# EasyEDA Pro project climbsnail-spotwelder-45c7d2f7.epro, board 大号控制板测试（可打板）
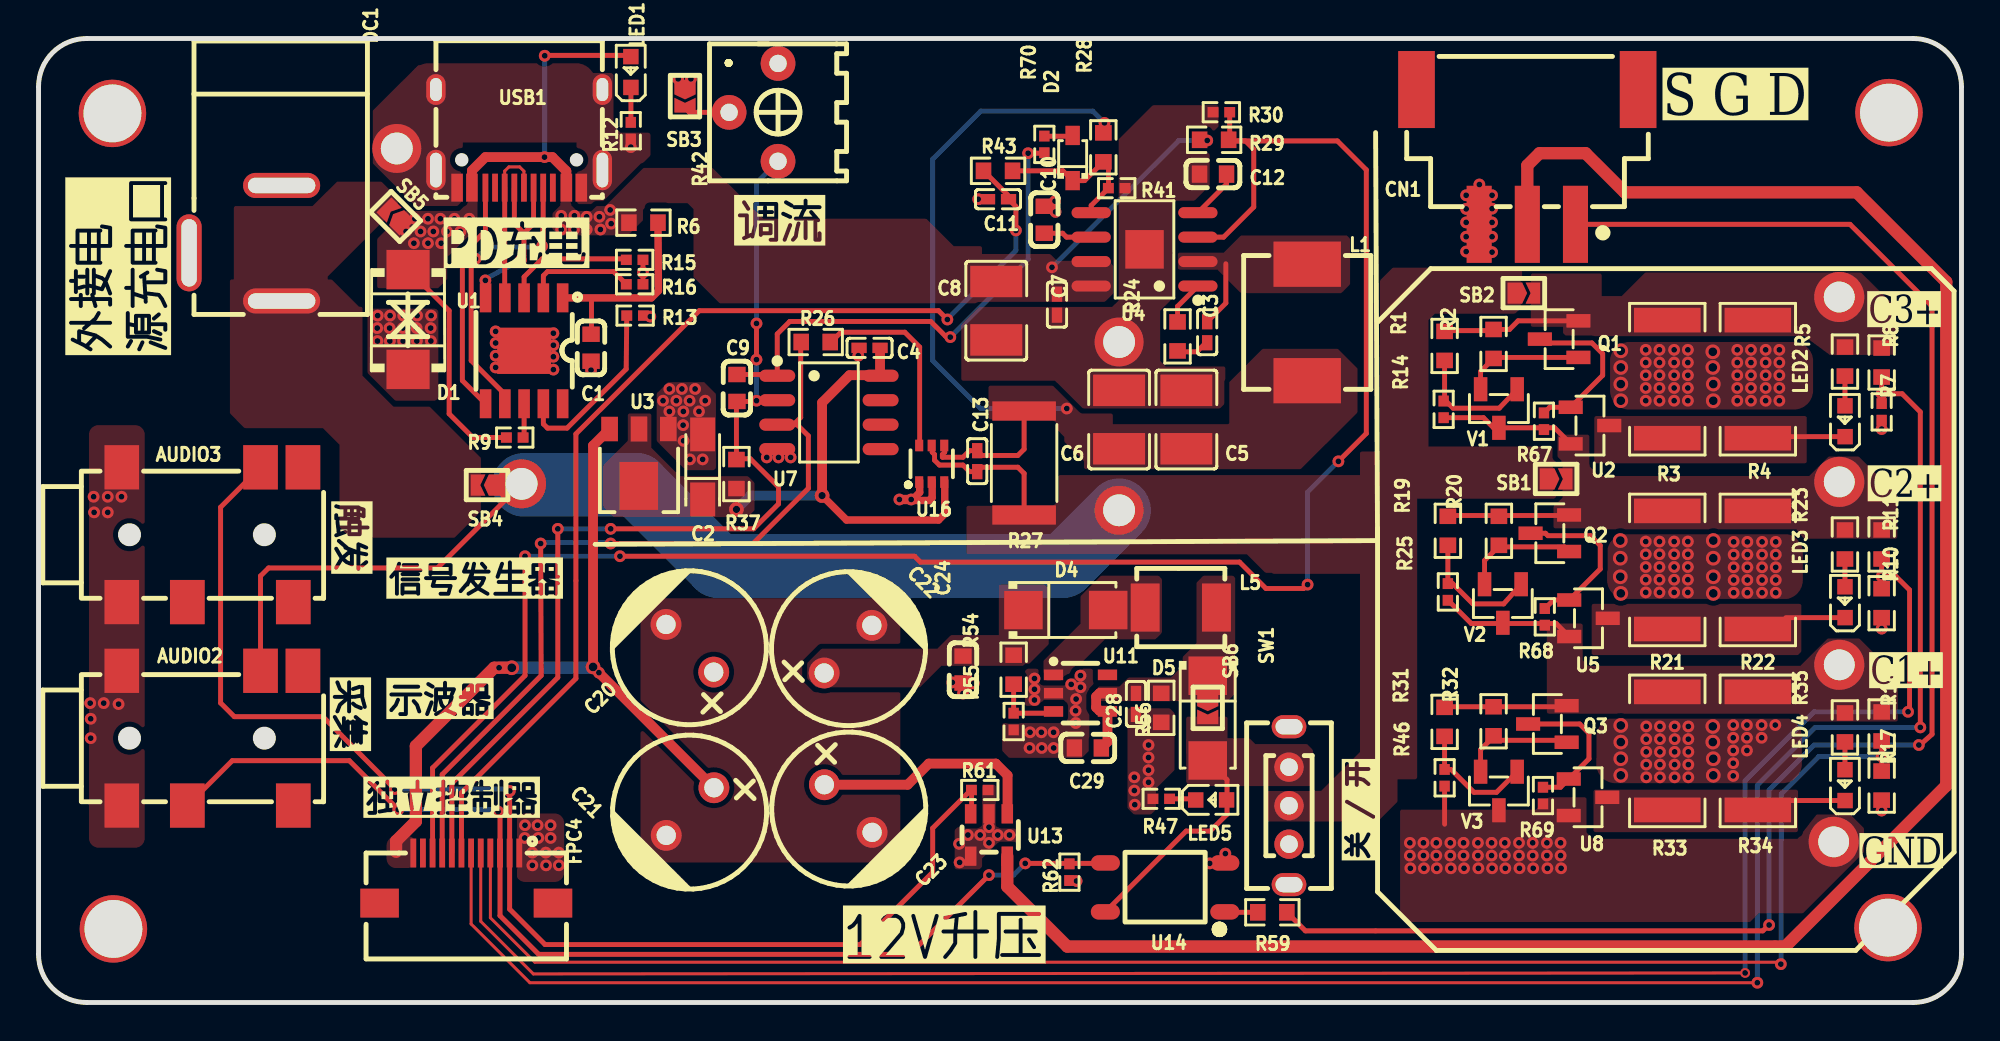
[diagram p4: board, top side]
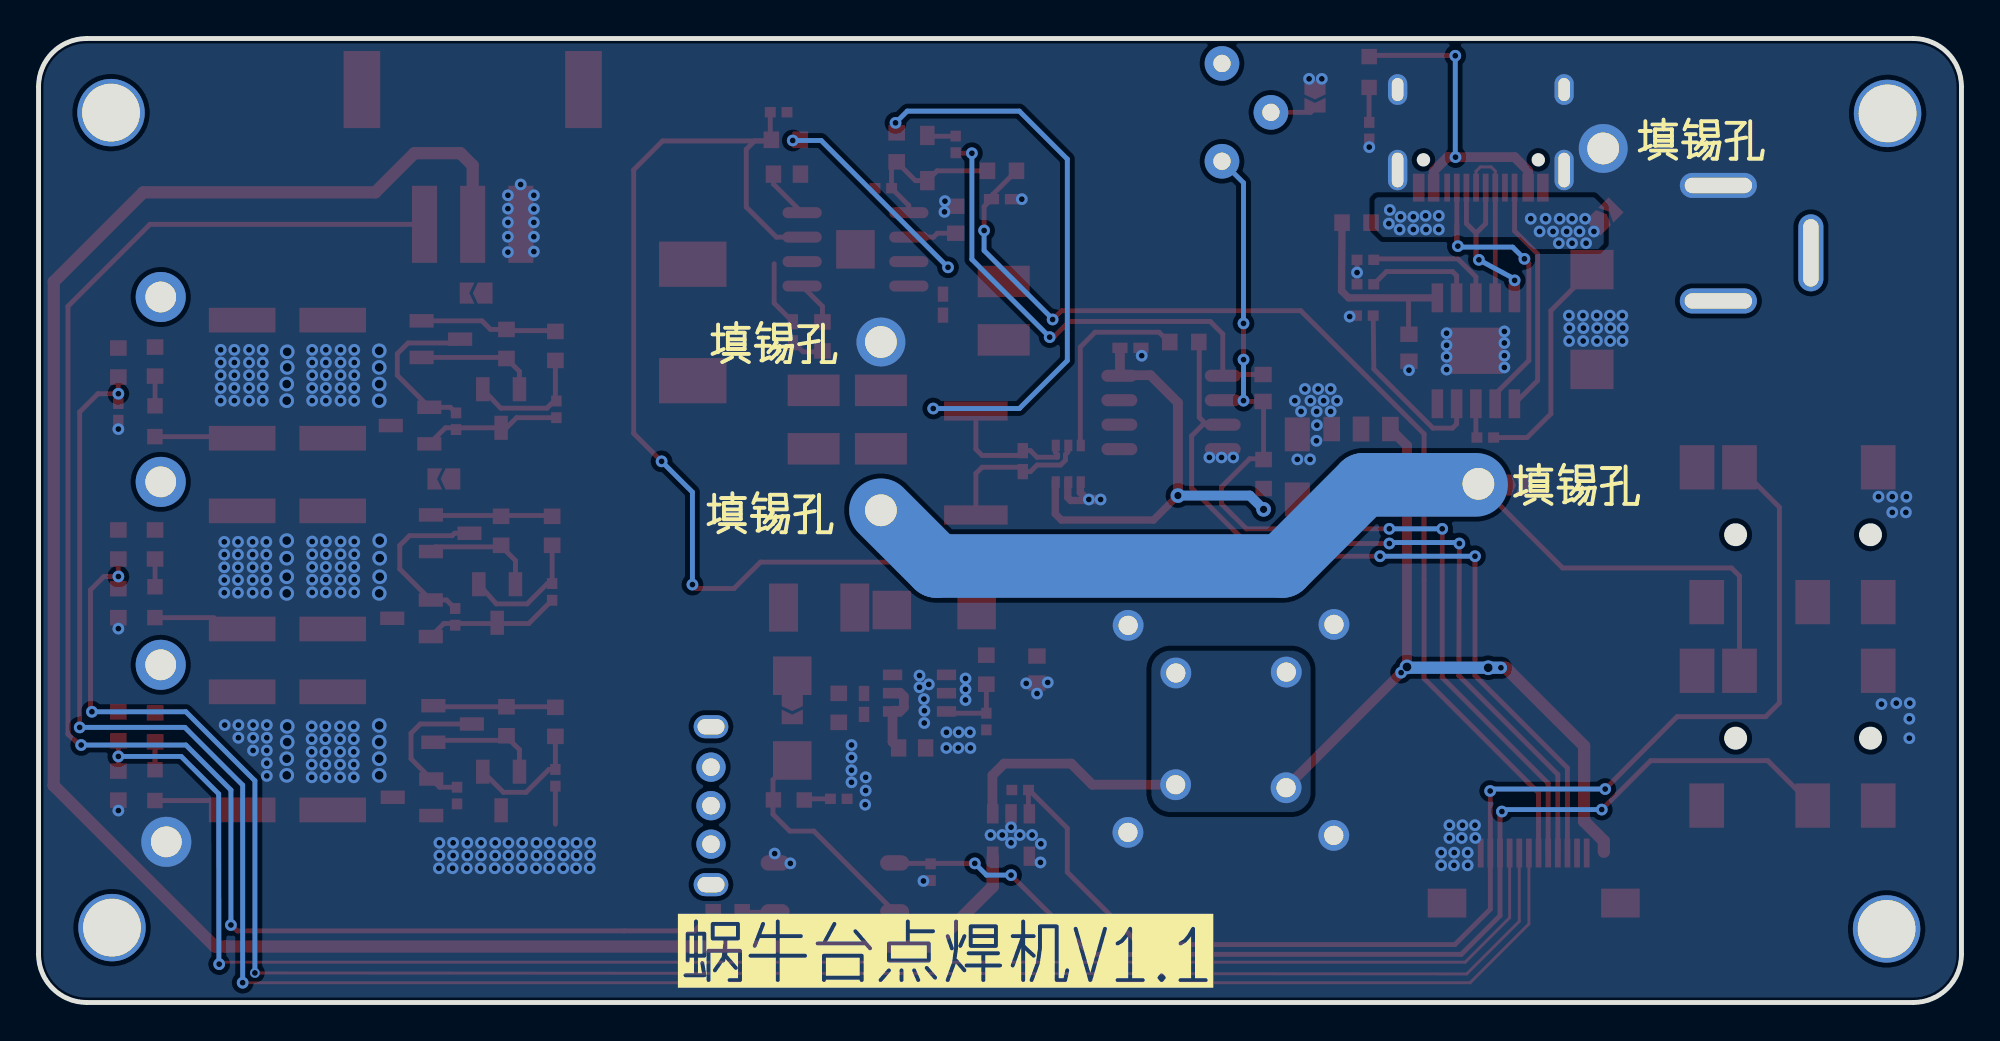
[diagram p5: board, bottom side, seen from below]

Outline 99.8 x 50.06 mm; copper layers: Top Layer, Bottom Layer. Coordinates in mm from the lower left corner of the outline.
Outline path: 0,47.56 0,2.5 arc(0.73,0.73) 2.5,0 97.3,0 arc(99.07,0.73) 99.8,2.5 99.8,47.56 arc(99.07,49.33) 97.3,50.06 2.5,50.06 arc(0.73,49.33) 0,47.56
Stack: Top Layer 0.035mm / Dielectric1 1.51mm FR4 er 4.5 / Bottom Layer 0.035mm

## Design rules (mm)
spacing copperThickness1oz (default): track to track 0.102, other pairs 0.152 to 0.3
spacing copperThickness2oz: track to track 0.203, other pairs 0.152 to 0.3
spacing Plane_innerPlane: track to track 0.102, other pairs 0.152 to 0.3
spacing Copper_copperRegion: track to track 0.102, other pairs 0.152 to 0.3
track width copperThickness1oz (default): min 0.127, default 0.254, max 2.54
track width copperThickness2oz: min 0.203, default 0.254, max 2.54
differential pair differentialPair (default): width min 0.127, default 0.254, max 2.54; gap min 0.152, default 0.152
pour e541 uses Copper_copperRegion
pour e543 uses Copper_copperRegion
pour e545 uses Copper_copperRegion
pour e547 uses Copper_copperRegion
pour e549 uses Copper_copperRegion
pour e551 uses Copper_copperRegion
pour e553 uses Copper_copperRegion
pour e555 uses Copper_copperRegion
pour e557 uses Copper_copperRegion
pour e559 uses Copper_copperRegion
pour e561 uses Copper_copperRegion
pour e563 uses Copper_copperRegion
pour e565 uses Copper_copperRegion
pour e567 uses Copper_copperRegion
pour e569 uses Copper_copperRegion
pour e571 uses Copper_copperRegion
pour e573 uses Copper_copperRegion
pour e575 uses Copper_copperRegion
pour e577 uses Copper_copperRegion
pour e579 uses Copper_copperRegion
pour e581 uses Copper_copperRegion
pour e583 uses Copper_copperRegion
pour e585 uses Copper_copperRegion
pour e587 uses Copper_copperRegion
pour e589 uses Copper_copperRegion
pour e591 uses Copper_copperRegion
pour e593 uses Copper_copperRegion
pour e595 uses Copper_copperRegion
pour e597 uses Copper_copperRegion
pour e599 uses Copper_copperRegion
pour e601 uses Copper_copperRegion
pour e603 uses Copper_copperRegion
pour e605 uses Copper_copperRegion
pour e607 uses Copper_copperRegion
pour e609 uses Copper_copperRegion
pour e611 uses Copper_copperRegion
pour e613 uses Copper_copperRegion
pour e615 uses Copper_copperRegion
pour e617 uses Copper_copperRegion
pour e619 uses Copper_copperRegion
pour e621 uses Copper_copperRegion
pour e623 uses Copper_copperRegion
pour e625 uses Copper_copperRegion
pour e627 uses Copper_copperRegion
pour e629 uses Copper_copperRegion
pour e631 uses Copper_copperRegion
pour e633 uses Copper_copperRegion
pour e635 uses Copper_copperRegion
pour e637 uses Copper_copperRegion

## Placement (name value [footprint] x y rotation side)
AUDIO2  -  [AUDIO-SMD_PJ-3420-A-SMT_C319102]  9.02 13.73 0 top
AUDIO3  -  [AUDIO-SMD_PJ-3420-A-SMT_C319102]  9.02 24.29 0 top
C1  -  [C0603]  28.68 34 90 top
C2  -  [CAP-SMD-钽_3216]  34.47 27.82 90 top
C3  -  [C0402]  60.65 34.81 270 top
C4  -  [C0402]  43.13 34 180 top
C5  -  [C1210]  59.57 30.27 90 top
C6  -  [C1210]  56.08 30.27 90 top
C7  -  [C0402]  52.86 36.24 90 top
C8  -  [C1210]  49.71 35.93 270 top
C9  -  [C0603]  36.25 31.91 90 top
C10  -  [C0603]  52.2 40.65 270 top
C11  -  [C0402]  49.8 41.72 180 top
C12  -  [C0603]  60.96 43.02 0 top
C13  -  [C0402]  48.72 28.11 90 top
C20  -  [CAP-TH_BD8.0-P3.50-D0.6-FD_1]  33.8 18.4 135 top
C21  -  [CAP-TH_BD8.0-P3.50-D0.6-FD_1]  33.81 9.91 225 top
C22  -  [CAP-TH_BD8.0-P3.50-D0.6-FD_1]  42.01 18.35 45 top
C23  -  [CAP-TH_BD8.0-P3.50-D0.6-FD_1]  42.02 10.07 315 top
C24  -  [C0603]  47.98 17.29 90 top
C28  -  [C0402]  56.96 15.5 90 top
C29  -  [C0603]  54.46 13.22 0 top
CN1  -  [CONN-SMD_3P-P2.50-WT]  77.27 43.91 180 top
D1  -  [SMB_L4.6-W3.6-LS5.3-BI]  19.18 35.47 270 top
D2  -  [SOD-323_L1.8-W1.3-LS2.5-RD]  53.67 43.85 90 top
D4  -  [SMA_L4.3-W2.6-LS5.2-RD]  53.31 20.38 0 top
D5  -  [SMA_L4.3-W2.6-LS5.2-RD]  60.68 14.77 270 top
DC1  -  [DC-IN-TH_DC-5520-1]  10.22 39.43 270 top
FPC4  -  [FPC-SMD_12P-P0.50_XW05200-12]  22.2 6.46 0 top
L1  -  [IND-SMD_L7.0-W6.6_MCW-0650-220]  65.84 35.32 90 top
L5  -  [IND-SMD_L4.5-W4.0-1]  59.28 20.51 180 top
LED1  -  [LED_0603]  30.73 48.37 90 top
LED2  -  [LED_0603]  93.75 30.24 90 top
LED3  -  [LED_0603]  93.75 20.84 90 top
LED4  -  [LED_0603]  93.75 11.34 90 top
LED5  -  [LED_0603]  60.91 10.53 0 top
NOREF  -  [Pad_e377]  56.08 25.56 0 top
NOREF#2  -  [Pad_e368]  93.46 36.64 0 top
NOREF#3  -  [Pad_e373]  3.89 3.82 90 top
NOREF#4  -  [Pad_e374]  3.84 46.17 0 top
NOREF#5  -  [Pad_e366]  56.08 34.3 0 top
NOREF#6  -  [Pad_e367]  93.17 8.34 0 top
NOREF#7  -  [Pad_e369]  93.46 27.04 0 top
NOREF#8  -  [Pad_e375]  25.07 26.93 0 top
NOREF#9  -  [Pad_e372]  96.04 46.21 0 top
NOREF#10  -  [Pad_e376]  18.59 44.35 0 top
NOREF#11  -  [Pad_e370]  93.46 17.54 0 top
NOREF#12  -  [Pad_e371]  95.99 3.89 180 top
Q1  -  [SOT-23-3_L2.9-W1.3-P1.90-LS2.4-BR]  78.92 34.45 0 top
Q2  -  [SOT-23-3_L2.9-W1.3-P1.90-LS2.4-BR]  78.44 24.37 0 top
Q3  -  [SOT-23-3_L2.9-W1.3-P1.90-LS2.4-BR]  78.31 14.46 0 top
R1  -  [R0603]  72.97 34.1 90 top
R2  -  [R0603]  75.51 34.2 90 top
R3  -  [R2512]  84.53 32.37 90 top
R4  -  [R2512]  89.23 32.37 90 top
R5  -  [R0603]  93.75 33.28 90 top
R6  -  [R0603]  31.39 40.5 0 top
R7  -  [R0402]  95.66 30.67 90 top
R8  -  [R0603]  95.66 33.23 270 top
R9  -  [R0402]  24.71 29.34 180 top
R10  -  [R0603]  95.66 20.74 270 top
R11  -  [R0603]  95.66 23.78 270 top
R12  -  [R0402]  30.74 45.27 90 top
R13  -  [R0402]  30.96 35.67 0 top
R14  -  [R0402]  72.92 30.8 90 top
R15  -  [R0402]  30.94 38.57 180 top
R16  -  [R0402]  30.94 37.3 0 top
R17  -  [R0603]  95.66 11.26 270 top
R18  -  [R0603]  95.66 14.34 270 top
R19  -  [R0603]  73.14 24.5 90 top
R20  -  [R0603]  75.79 24.5 90 top
R21  -  [R2512]  84.53 22.46 90 top
R22  -  [R2512]  89.23 22.46 90 top
R23  -  [R0603]  93.75 23.78 90 top
R24  -  [R0603]  59.11 34.59 90 top
R25  -  [R0402]  73.14 21.32 90 top
R26  -  [R0603]  40.34 34.3 180 top
R27  -  [R2512#2]  51.15 28.02 270 top
R28  -  [R0603]  55.26 44.41 90 top
R29  -  [R0603]  61.01 44.8 0 top
R30  -  [R0402]  61.39 46.23 0 top
R31  -  [R0603]  72.97 14.57 90 top
R32  -  [R0603]  75.51 14.6 90 top
R33  -  [R2512]  84.53 13.07 90 top
R34  -  [R2512]  89.23 13.07 90 top
R35  -  [R0603]  93.75 14.29 90 top
R37  -  [R0603]  36.22 27.44 90 top
R41  -  [R0402]  55.96 42.29 180 top
R42  -  [RES-ADJ-TH_3P-L7.1-W6.9-P2.50-L_3362P]  37.11 46.23 90 top
R43  -  [R0603]  49.8 43.19 0 top
R46  -  [R0402]  72.97 11.67 90 top
R47  -  [R0402]  58.27 10.58 180 top
R54  -  [R0603]  50.61 17.28 90 top
R55  -  [R0402]  50.61 14.59 90 top
R56  -  [R0603]  58.27 15.3 90 top
R59  -  [R0603]  64.03 4.68 180 top
R61  -  [R0402]  48.85 11.03 180 top
R62  -  [R0402]  53.5 6.77 90 top
R67  -  [R0402]  78.13 30.19 90 top
R68  -  [R0402]  78.17 20.03 90 top
R69  -  [R0402]  78.08 10.75 90 top
R70  -  [R0402]  52.2 44.56 90 top
SB1  -  [短路点]  78.95 27.19 180 top
SB2  -  [短路点]  77.28 36.84 180 top
SB3  -  [短路点]  33.55 46.88 90 top
SB4  -  [短路点]  23.09 26.87 0 top
SB5  -  [短路点]  18.39 40.96 315 top
SB6  -  [短路点]  60.68 15.11 90 top
SW1  -  [SW-TH_3P-L8.6-W4.5-P2.60]  64.9 10.22 90 top
U1  -  [ESOP-10_L4.9-W3.9-P1.00-LS6.2-BL-EP]  25.2 33.84 180 top
U2  -  [SOT-23-3_L2.9-W1.3-P1.90-LS2.4-BL-2]  80.52 29.96 270 top
U3  -  [SOT89L]  31.16 28.31 180 top
U4  -  [SOIC-8_L5.0-W4.0-P1.27-LS6.0-BL-EP2.0]  57.4 39.11 90 top
U5  -  [SOT-23-3_L2.9-W1.3-P1.90-LS2.4-BL-2]  80.44 19.95 270 top
U7  -  [SOP-8_L4.9-W3.9-P1.27-LS6.0-BL]  41.02 30.64 270 top
U8  -  [SOT-23-3_L2.9-W1.3-P1.90-LS2.4-BL-2]  80.42 10.66 270 top
U11  -  [SOT-23-6_L2.9-W1.6-P0.95-LS2.8-BR]  54.08 16.06 180 top
U13  -  [SOT-23-5_L2.9-W1.6-P0.95-LS2.8-BR]  49.33 8.7 90 top
U14  -  [SOP-4_L4.4-W3.6-P2.54-LS7.0-TL]  58.47 5.98 180 top
U16  -  [SC-70-6_L2.2-W1.3-P0.65-LS2.1-BR]  46.35 27.98 270 top
USB1  -  [USB-C-SMD_TYPEC-304-BCP16]  24.94 44.86 180 top
V1  -  [SOT-23-3_L2.9-W1.3-P1.90-LS2.4-BR]  75.79 30.85 90 top
V2  -  [SOT-23-3_L2.9-W1.3-P1.90-LS2.4-BR]  76 20.72 90 top
V3  -  [SOT-23-3_L2.9-W1.3-P1.90-LS2.4-BR]  75.79 10.98 90 top

## Footprints (pads in the part's own frame, mm; a bottom-side part is the same pattern mirrored in y, then rotated)
AUDIO-SMD_PJ-3420-A-SMT_C319102
  rect 1.8x2.3 smd: 1(-4.7,-3.5) 2(-4.7,3.5) 3(-1.3,-3.5) 4(2.5,3.5) 5(4.7,3.5) 6(4.2,-3.5)
C0402
  rect 0.79x0.54 smd: 1(-0.545,0) 2(0.545,0)
C0603
  rect 0.8x0.9 smd: 1(-0.7,0) 2(0.7,0)
C1210
  rect 1.635x2.7 smd: 1(-1.518,0) 2(1.518,0)
CAP-SMD-钽_3216
  rect 1.758x1.296 smd: 1(-1.687,0) 2(1.687,0)
CAP-TH_BD8.0-P3.50-D0.6-FD_1
  round 1.6 hole 1: 1(-1.75,0) 2(1.75,0)
CONN-SMD_3P-P2.50-WT
  rect 1.3x4 smd: 1(-2.499,3.5) 2(0,3.5) 3(2.499,3.5)
  rect 1.9x4 smd: 4(-5.75,-3.5) 5(5.75,-3.5)
DC-IN-TH_DC-5520-1
  oval 4x1.3 hole 3.5x0.8: 2(0.5,-2.4)
  oval 1.3x4 hole 0.8x3.5: 3(-3,2.4) 4(3,2.4)
ESOP-10_L4.9-W3.9-P1.00-LS6.2-BL-EP
  rect 0.6x1.5 smd: 1(-2,-2.75) 2(-1,-2.75) 3(0,-2.75) 4(1,-2.75) 5(2,-2.75) 6(2,2.75) 7(1,2.75) 8(0,2.75) 9(-1,2.75) 10(-2,2.75)
  rect 2.8x2.4 smd: 11(0,0)
FPC-SMD_12P-P0.50_XW05200-12
  rect 0.3x1.5 smd: 1(2.75,1.3) 2(2.25,1.3) 3(1.75,1.3) 4(1.25,1.3) 5(0.75,1.3) 6(0.25,1.3) 7(-0.25,1.3) 8(-0.75,1.3) 9(-1.25,1.3) 10(-1.75,1.3) 11(-2.25,1.3) 12(-2.75,1.3)
  rect 2x1.5 smd: 13(-4.5,-1.3) 14(4.5,-1.3)
IND-SMD_L4.5-W4.0-1
  rect 1.501x2.499 smd: 1(-1.849,0) 2(1.849,0)
IND-SMD_L7.0-W6.6_MCW-0650-220
  rect 2.349x3.5 smd: 1(-3.025,0) 2(3.025,0)
LED_0603
  rect 0.8x0.8 smd: 1(-0.851,-0.01) 2(0.75,-0.005)
Pad_e366
  round 2.54 hole 1.651: 14(0,0)
Pad_e367
  round 2.6 hole 1.6: 1(0,0)
Pad_e368
  round 2.6 hole 1.6: 1(0,0)
Pad_e369
  round 2.6 hole 1.6: 1(0,0)
Pad_e370
  round 2.6 hole 1.6: 1(0,0)
Pad_e371
  round 3.5 hole 3: 1(0,0)
Pad_e372
  round 3.5 hole 3: 1(0,0)
Pad_e373
  round 3.5 hole 3: 1(0,0)
Pad_e374
  round 3.5 hole 3: 1(0,0)
Pad_e375
  round 2.54 hole 1.651: 14(0,0)
Pad_e376
  round 2.54 hole 1.651: 14(0,0)
Pad_e377
  round 2.54 hole 1.651: 14(0,0)
R0402
  rect 0.566x0.54 smd: 1(-0.433,0) 2(0.433,0)
R0603
  rect 0.806x0.864 smd: 1(-0.753,0) 2(0.753,0)
R2512
  rect 1.282x3.456 smd: 1(-3.067,0) 2(3.067,0)
R2512#2
  rect 1x3.3 smd: 1(-2.7,0) 2(2.7,0)
RES-ADJ-TH_3P-L7.1-W6.9-P2.50-L_3362P
  round 1.801 hole 0.899: 1(-2.54,-1.27) 2(0,1.27) 3(2.54,-1.27)
SC-70-6_L2.2-W1.3-P0.65-LS2.1-BR
  rect 0.6x0.42 smd: 1(0.95,-0.65) 2(0.95,0) 3(0.95,0.65) 4(-0.95,0.65) 5(-0.95,0) 6(-0.95,-0.65)
SMA_L4.3-W2.6-LS5.2-RD
  rect 2x2 smd: 1(-2.2,0) 2(2.2,0)
SMB_L4.6-W3.6-LS5.3-BI
  rect 2.047x2.241 smd: 1(-2.591,0) 2(2.591,0)
SOD-323_L1.8-W1.3-LS2.5-RD
  rect 1x0.75 smd: 1(-1.173,0) 2(1.173,0)
SOIC-8_L5.0-W4.0-P1.27-LS6.0-BL-EP2.0
  oval 0.574x2.038 smd: 1(-1.905,-2.769) 2(-0.635,-2.769) 3(0.635,-2.769) 4(1.905,-2.769) 5(1.905,2.769) 6(0.635,2.769) 7(-0.635,2.769) 8(-1.905,2.769)
  rect 2x2 smd: 9(0,0)
SOP-4_L4.4-W3.6-P2.54-LS7.0-TL
  oval 1.508x0.8 smd: 1(-3.1,1.27) 2(-3.1,-1.27) 3(3.1,-1.27) 4(3.1,1.27)
SOP-8_L4.9-W3.9-P1.27-LS6.0-BL
  oval 0.63x1.865 smd: 1(-1.905,-2.683) 2(-0.635,-2.683) 3(0.635,-2.683) 4(1.905,-2.683) 5(1.905,2.683) 6(0.635,2.683) 7(-0.635,2.683) 8(-1.905,2.683)
SOT89L
  rect 0.864x1.27 smd: 1(-1.524,-1.475) 3(1.524,-1.475)
  rect 0.864x1.3 smd: 2(0,-1.475)
  rect 2x2.5 smd: 4(0.001,1.475)
SOT-23-3_L2.9-W1.3-P1.90-LS2.4-BL-2
  rect 0.7x1.25 smd: 1(-0.95,-1) 2(0.95,-1) 3(0,1)
SOT-23-3_L2.9-W1.3-P1.90-LS2.4-BR
  rect 1.25x0.701 smd: 1(1.001,-0.95) 2(1.001,0.95) 3(-1.001,0)
SOT-23-5_L2.9-W1.6-P0.95-LS2.8-BR
  rect 1.001x0.6 smd: 1(1.1,-0.95) 2(1.1,0) 3(1.1,0.95) 4(-1.1,0.95) 5(-1.1,-0.95)
SOT-23-6_L2.9-W1.6-P0.95-LS2.8-BR
  rect 1x0.55 smd: 1(1.4,-0.95) 2(1.4,0) 3(1.4,0.95) 4(-1.4,0.95) 5(-1.4,0) 6(-1.4,-0.95)
SW-TH_3P-L8.6-W4.5-P2.60
  round 1.524 hole 0.914: 1(-2,0) 2(0,0) 3(2,0)
  oval 1.2x1.8 hole 0.8x1.4: 4(-4.1,0) 5(4.1,0)
USB-C-SMD_TYPEC-304-BCP16
  oval 1.001x2.1 hole 0.6x1.801: 13(-4.321,1.633) 14(4.321,1.633)
  oval 1.001x1.6 hole 0.6x1.199: 15(-4.321,-2.547) 16(4.321,-2.547)
  rect 0.6x1.45 smd: A1B12(-3.226,2.547) A4B9(-2.451,2.547) B1A12(3.22,2.547) B4A9(2.451,2.547)
  rect 0.299x1.45 smd: A5(-1.25,2.547) A6(-0.249,2.547) A7(0.249,2.547) A8(1.25,2.547) B5(1.75,2.547) B6(0.75,2.547) B7(-0.75,2.547) B8(-1.75,2.547)
短路点
  custom 0x0 smd: 1(-0.66,0) 2(1.042,0)

## Nets
3V3: C2.1 C4.1 R37.1 U3.2 U3.4 U7.8 U16.3
+12V: C20.1 C21.1 C22.1 C23.1 C24.2 D4.1 FPC4.12 R54.2 U3.3 U13.1
GND: AUDIO2.1 AUDIO2.2 AUDIO3.1 AUDIO3.2 C1.1 C2.2 C4.2 C5.2 C6.2 C7.1 C8.2 C10.1 C11.2 C12.1 C20.2 C21.2 C22.2 C23.2 C24.1 C28.1 C29.1 CN1.3 D1.2 DC1.3 FPC4.1 NOREF#5.14 NOREF#6.1 NOREF#10.14 R7.1 R10.2 R12.1 R13.2 R15.1 R16.2 R17.2 R30.1 R41.1 R46.1 R47.2 R55.1 R56.1 R61.1 R62.1 R69.1 SB3.2 U1.11 U3.1 U4.9 U7.4 U8.2 U11.2 U13.2 U13.4 U14.2 U16.1 U16.2 USB1.13 USB1.14 USB1.15 USB1.16 USB1.A1B12 USB1.B1A12 V3.3
VBUS: C7.2 C8.1 D1.1 LED1.2 R6.1 R9.2 R29.1 SB5.2 U4.7 U4.8 USB1.A4B9 USB1.B4A9
+CAP: AUDIO2.4 C13.1 NOREF.14 NOREF#8.14 R27.2 SB1.2 SB2.2 SB4.2 SW1.2 U16.5
CAP1: NOREF#11.1 Q3.2 R18.1 R25.1 R31.2 R32.2 R33.2 R34.2 R35.2 R68.1 U5.2 V2.3
CAP1_VOL: FPC4.4 R17.1 R18.2
CAP2: NOREF#7.1 Q2.2 R11.1 R14.1 R19.2 R20.2 R21.2 R22.2 R23.2 R67.1 SB1.1 U2.2 V1.3
CAP2_VOL: FPC4.5 R10.1 R11.2
CAP3: NOREF#2.1 Q1.2 R1.2 R2.2 R3.2 R4.2 R5.2 R8.1 SB2.1
CAP3_VOL: FPC4.6 R7.2 R8.2
CC1: U1.7 USB1.A5
CC2: U1.6 USB1.B5
CH224K_VDD: C1.2 R6.2 U1.1
CUR_OUT: FPC4.9 R26.2 U7.3
MOS_D1: CN1.1 R59.1
MOS_G1: CN1.2 U13.5
MOS_SW1: AUDIO3.4 FPC4.2 R61.2 U13.3
PWR_CUR_DAC: C9.1 FPC4.8 R37.2 R42.1 U7.2
PWR_EN: FPC4.10 R29.2 R30.2 U4.3
PWR_VOL_DAC: C11.1 FPC4.7 R43.1
SHORT_EN1: AUDIO2.3 FPC4.3 R62.2 U14.3
USB_DM: U1.5 USB1.A7 USB1.B7
USB_DP: U1.4 USB1.A6 USB1.B6
WORK+: D5.2 LED5.2 SB6.1 SW1.3 U14.4
$1N2186: R54.1 R55.2 U11.3
$1N2189: D4.2 L5.2 U11.1
$1N2220: R16.1 U1.2
$1N2250: R24.2 U4.1
$1N2253: C3.1 L1.2 U4.2
$1N2275: C10.2 U4.6
$1N2339: C12.2 U4.4
$1N16279: R59.2 U14.1
$1N16747: R31.1 R46.2 V3.1
$1N16916: LED4.2 R35.1
$1N17016: LED4.1 R33.1 R34.1 U8.3
$1N17036: Q3.1 R32.1 V3.2
$1N17466: R19.1 R25.2 V2.1
$1N17469: LED3.2 R23.1
$1N17478: LED3.1 R21.1 R22.1 U5.3
$1N17488: Q2.1 R20.1 V2.2
$1N17839: R1.1 R14.2 V1.1
$1N17842: LED2.2 R5.1
$1N17851: LED2.1 R3.1 R4.1 U2.3
$1N17861: Q1.1 R2.1 V1.2
$1N18300: R9.1 U1.8
$1N18355: R15.2 U1.3
$1N18831: C3.2 R24.1
$1N19361: LED1.1 R12.2
$1N19390: LED5.1 R47.1
$1N34225: R42.2 SB3.1
$1N37928: R26.1 U16.6
$1N37952: C5.1 C6.1 C13.2 L1.1 R27.1 R28.2 U16.4
$1N40918: Q1.3 R67.2 U2.1
$1N40926: Q2.3 R68.2 U5.1
$1N40934: Q3.3 R69.2 U8.1
$1N40963: C9.2 R70.1 U7.1
$1N40964: D2.2 R70.2
$1N41094: DC1.4 SB4.1 SB5.1
$1N41187: D2.1 R28.1 R41.2 R43.2 U4.5
$1N41220: C28.2 C29.2 D5.1 L5.1 R56.2 SB6.2 U11.4 U11.5
$1N47018: R13.1 U1.9

Pads without a net: AUDIO2 5 6; AUDIO3 3 5 6; CN1 4 5; DC1 2; FPC4 11 13 14; NOREF#3 1; NOREF#4 1; NOREF#9 1; NOREF#12 1; R42 3; SW1 1 4 5; U1 10; U7 5 6 7; U11 6; USB1 A8 B8

## Via types
v1: diameter 0.762, hole 0.457, Top Layer to Bottom Layer, 26 vias
v2: diameter 0.61, hole 0.305, Top Layer to Bottom Layer, 336 vias
v3: diameter 0.762, hole 0.381, Top Layer to Bottom Layer, 2 vias
v4: diameter 0.508, hole 0.305, Top Layer to Bottom Layer, 1 via

## Routing (per net, layer and track width the routed paths; a pad name or vN(x,y) marks a point on that pad's centre or on a via; arc(x,y) is an arc through that point)
3V3:
  vias: v3(36.22,25.61) v3(40.67,26.32)
+12V:
  vias: v1(24.56,17.38) v1(28.78,17.43) v2(23.9,17.38) v2(29.08,17.13)
GND:
  vias: v1(82.09,23.99) v1(82.09,23.07) v1(82.09,22.11) v1(82.12,33.84) v1(82.12,32.98) v1(82.12,32.12) v1(82.12,31.25) v1(82.12,21.24) v1(82.12,14.39) v1(82.12,13.52) v1(82.12,12.66) v1(82.12,11.8) v1(86.89,33.79) v1(86.89,32.98) v1(86.89,14.34) v1(86.89,13.52) v1(86.92,32.12) v1(86.92,31.25) v1(86.92,23.99) v1(86.92,23.07) v1(86.92,22.11) v1(86.92,21.24) v1(86.92,12.66) v1(86.92,11.8) v2(2.68,15.55) v2(2.71,14.73) v2(2.71,13.73) v2(2.86,26.27) v2(2.88,25.45) v2(3.38,15.55) v2(3.59,26.27) v2(3.59,25.45) v2(4.15,15.5) v2(4.31,26.27) v2(17.6,35.67) v2(17.58,35.02) v2(17.59,34.35) v2(18.25,35.67) v2(18.22,35.02) v2(18.23,34.35) v2(18.91,35.02) v2(18.93,35.67) v2(18.92,34.35) v2(19.65,35.67) v2(19.62,35.02) v2(19.63,34.35) v2(20.37,35.67) v2(20.35,35.02) v2(20.36,34.35) v2(23.72,34.85) v2(23.72,34.25) v2(23.72,33.59) v2(23.72,32.98) v2(25.25,9.21) v2(25.23,8.54) v2(25.63,7.78) v2(25.63,7.12) v2(25.9,9.21) v2(25.94,8.54) v2(26.33,7.78) v2(26.34,7.12) v2(26.58,9.21) v2(26.58,8.54) v2(26.72,34.76) v2(26.72,34.13) v2(26.72,33.53) v2(26.72,32.87) v2(27,7.78) v2(27,7.12) v2(28.67,32.84) v2(30.74,44.42) v2(31.37,37.91) v2(31.75,35.62) v2(32.41,31.25) v2(32.74,31.86) v2(32.74,30.69) v2(33.1,31.25) v2(33.2,47.97) v2(33.39,31.86) v2(33.47,30.69) v2(33.45,29.98) v2(33.48,29.17) v2(33.79,31.25) v2(33.81,28.2) v2(33.86,47.97) v2(34.08,31.86) v2(34.28,30.69) v2(34.47,28.2) v2(34.6,31.25) v2(37.8,28.31) v2(38.4,28.31) v2(39.03,28.31) v2(42.55,33.59) v2(44.68,26.12) v2(45.29,26.12) v2(47.42,16.62) v2(47.78,8.24) v2(47.8,7.27) v2(47.98,16.04) v2(48.23,8.7) v2(48.54,16.57) v2(48.77,41.72) v2(48.87,8.7) v2(49.33,9.1) v2(49.33,8.29) v2(49.78,8.7) v2(50.39,8.7) v2(51.46,14.03) v2(51.44,13.22) v2(51.69,16.83) v2(51.69,16.27) v2(51.69,15.71) v2(52.04,14.03) v2(52.07,13.22) v2(52.68,14.03) v2(52.69,13.22) v2(52.76,41.62) v2(52.78,41.06) v2(53.59,16.52) v2(53.85,15.76) v2(53.82,15.15) v2(53.83,14.51) v2(53.87,6.31) v2(54.08,16.98) v2(54.08,16.37) v2(56.87,11.69) v2(56.87,11.01) v2(56.9,10.27) v2(57.61,13.37) v2(57.61,12.72) v2(57.61,12.06) v2(57.61,11.44) v2(60.78,7.22) v2(61.59,7.73) v2(71.17,8.29) v2(71.17,7.63) v2(71.2,6.97) v2(71.88,8.29) v2(71.88,7.63) v2(71.9,6.97) v2(72.54,8.29) v2(72.54,7.63) v2(72.57,6.97) v2(73.27,8.29) v2(73.27,7.63) v2(73.3,6.97) v2(73.96,8.29) v2(73.96,7.63) v2(73.98,6.97) v2(74.09,41.92) v2(74.09,41.21) v2(74.09,40.51) v2(74.09,39.77) v2(74.09,39) v2(74.7,8.29) v2(74.7,7.63) v2(74.78,42.48) v2(74.73,6.97) v2(75.44,41.92) v2(75.44,41.23) v2(75.44,40.51) v2(75.44,39.77) v2(75.44,38.97) v2(75.41,8.29) v2(75.41,7.63) v2(75.44,6.97) v2(76.1,8.29) v2(76.1,7.63) v2(76.12,6.97) v2(76.84,8.29) v2(76.84,7.63) v2(76.86,6.97) v2(77.55,8.29) v2(77.55,7.63) v2(77.57,6.97) v2(78.28,8.29) v2(78.28,7.63) v2(78.31,6.97) v2(78.99,8.29) v2(78.99,7.63) v2(79.02,6.97) v2(83.41,33.89) v2(83.41,33.23) v2(83.41,32.57) v2(83.41,31.91) v2(83.41,31.25) v2(83.41,23.94) v2(83.41,23.28) v2(83.41,22.62) v2(83.41,21.96) v2(83.41,21.3) v2(83.44,14.34) v2(83.44,13.68) v2(83.44,13.02) v2(83.44,12.35) v2(83.44,11.69) v2(84.12,33.89) v2(84.12,33.23) v2(84.12,32.57) v2(84.12,31.91) v2(84.12,31.25) v2(84.12,23.94) v2(84.12,23.28) v2(84.12,22.62) v2(84.12,21.96) v2(84.12,21.3) v2(84.15,14.34) v2(84.15,13.68) v2(84.15,13.02) v2(84.15,12.35) v2(84.15,11.69) v2(84.89,33.89) v2(84.89,33.23) v2(84.89,32.57) v2(84.89,31.91) v2(84.89,31.25) v2(84.89,23.94) v2(84.89,23.28) v2(84.89,22.62) v2(84.89,21.96) v2(84.89,21.3) v2(84.91,14.34) v2(84.91,13.68) v2(84.91,13.02) v2(84.91,12.35) v2(84.91,11.69) v2(85.6,33.89) v2(85.6,33.23) v2(85.6,32.57) v2(85.6,31.91) v2(85.6,31.25) v2(85.6,23.94) v2(85.6,23.28) v2(85.6,22.62) v2(85.6,21.96) v2(85.6,21.3) v2(85.62,14.34) v2(85.62,13.68) v2(85.62,13.02) v2(85.62,12.35) v2(85.62,11.69) v2(87.98,23.92) v2(87.98,23.26) v2(87.98,22.6) v2(87.98,21.94) v2(87.98,21.28) v2(87.95,14.41) v2(87.95,13.75) v2(87.95,13.09) v2(87.95,12.43) v2(87.95,11.77) v2(88.16,33.89) v2(88.16,33.23) v2(88.16,32.57) v2(88.16,31.91) v2(88.16,31.25) v2(88.69,23.92) v2(88.69,23.26) v2(88.69,22.6) v2(88.69,21.94) v2(88.69,21.28) v2(88.66,14.41) v2(88.66,13.75) v2(88.66,13.09) v2(88.87,33.89) v2(88.87,33.23) v2(88.87,32.57) v2(88.87,31.91) v2(88.87,31.25) v2(89.45,23.92) v2(89.45,23.26) v2(89.45,22.6) v2(89.45,21.94) v2(89.45,21.28) v2(89.43,14.41) v2(89.43,13.75) v2(89.64,33.89) v2(89.64,33.23) v2(89.64,32.57) v2(89.64,31.91) v2(89.64,31.25) v2(90.16,23.92) v2(90.16,23.26) v2(90.16,22.6) v2(90.16,21.94) v2(90.16,21.28) v2(90.14,14.41) v2(90.35,33.89) v2(90.35,33.23) v2(90.35,32.57) v2(90.35,31.91) v2(90.35,31.25) v2(95.66,29.78) v2(95.66,19.42) v2(95.66,9.97)
VBUS:
  vias: v2(19.07,40.04) v2(19.48,39.43) v2(19.53,40.7) v2(19.83,40.04) v2(20.21,40.7) v2(20.21,39.43) v2(20.49,40.04) v2(20.85,40.7) v2(20.9,39.43) v2(21.2,40.04) v2(21.58,40.7) v2(21.9,40.04) v2(22.36,40.7) v2(26.27,49.17) v2(26.26,43.9) v2(27.13,40.85) v2(27.13,40.14) v2(27.79,40.14) v2(27.81,40.85) v2(28.45,40.8) v2(28.45,40.14) v2(29.11,40.8) v2(29.16,40.14) v2(29.67,41.16) v2(29.72,40.45) v2(52.6,38.18) v2(60.66,44.77)
+CAP: length 3.4
  Top Layer w0.254: C13.1 48.32,27.57 47.98,27.91 46.76,27.91 46.5,28.16 46.5,28.46 46.38,28.58 46.38,29.01
CAP1_VOL:
  vias: v2(90.42,1.99) v2(95.66,12.78)
CAP2_VOL:
  vias: v2(95.66,22.12) v2(97.03,15.1) v4(88.57,1.53)
CAP3_VOL:
  vias: v2(89.21,1.03) v2(95.66,31.61) v2(97.66,14.29)
CC1:
  vias: v2(22.68,38.62) v2(26.14,39.28)
CUR_OUT:
  vias: v2(26.06,23.84) v2(29.69,23.84)
MOS_D1:
  vias: v2(89.81,4.02) v2(97.59,13.37)
MOS_SW1:
  vias: v2(18.49,11.08) v2(24.46,10.98)
PWR_CUR_DAC:
  vias: v2(26.95,24.6) v2(29.69,24.6) v2(37.26,35.27) v2(37.26,33.39) v2(37.26,31.25)
PWR_EN:
  vias: v2(25.25,23.18) v2(30.18,23.18) v2(65.86,21.7) v2(67.46,28.1)
PWR_VOL_DAC:
  vias: v2(47.17,35.47) v2(50.72,40.09)
SHORT_EN1:
  vias: v2(18.67,10.02) v2(23.85,9.92) v2(49.33,6.61) v2(51.21,7.22)
USB_DM:
  vias: v2(23.19,37.5) v2(25.04,38.57)
$1N37952: length 2.7
  Top Layer w0.254: C13.2 48.32,28.66 47.98,28.32 46.92,28.32 46.91,28.33 46.91,28.46 47.03,28.58 47.03,29.01
  vias: v2(53.37,30.85) v2(55.32,45.68)
$1N40963:
  vias: v2(47.32,34.55) v2(51.36,44.1)

## Copper pours and planes (outline as drawn; the poured copper is in the pictures)
3V3 on Top Layer: 30.58,30.59 31.8,30.59 31.8,28.81 33.28,27.33 36.81,27.33 37.16,26.99 37.16,25.56 36.8,25.21 29.84,25.21 29.31,25.74 29.31,27.9 30.58,29.17
+12V on Top Layer: 18.06,8.15 18.07,8.25 18.12,8.39 18.21,8.5 18.32,8.59 18.45,8.64 18.56,8.65 19.13,8.65 19.23,8.64 19.37,8.59 19.48,8.5 19.57,8.39 19.62,8.25 19.63,8.15 19.63,7.48 19.62,7.37 19.57,7.24 19.48,7.13 19.37,7.04 19.23,6.99 19.13,6.98 18.56,6.98 18.45,6.99 18.32,7.04 18.21,7.13 18.12,7.24 18.07,7.37 18.06,7.48
+12V on Top Layer: 49.84,21.7 49.84,17.99 50.24,17.59 51.41,17.59 52.43,18.61 52.43,21.48 52.21,21.7
+12V on Top Layer: 47.36,19.08 46.65,18.37 40.64,18.37 39.89,17.62 39.89,16.83 40.35,16.37 45.75,16.37 46.86,17.49 51.1,17.49 51.21,17.59 51.21,19.08 51.2,19.08
+12V on Bottom Layer: 33.78,17.27 33.8,17.45 33.85,17.64 33.94,17.82 34.07,17.98 34.23,18.11 34.41,18.2 34.6,18.26 34.78,18.27 41.05,18.27 41.22,18.26 41.42,18.2 41.6,18.11 41.76,17.98 41.88,17.82 41.98,17.64 42.03,17.45 42.05,17.27 42.05,10.89 42.03,10.71 41.98,10.52 41.88,10.34 41.76,10.18 41.6,10.06 41.42,9.96 41.22,9.91 41.05,9.89 34.78,9.89 34.6,9.91 34.41,9.96 34.23,10.06 34.07,10.18 33.94,10.34 33.85,10.52 33.8,10.71 33.78,10.89
GND on Top Layer: 27.92,43.07 27.92,41.56 28.02,41.46 29.24,41.46 31.76,43.99 31.76,45.08 31.67,45.17 30.2,45.17 29.84,45.53 29.84,48.17 29.74,48.27 28.12,48.27 27.91,48.07 27.91,43.07
GND on Top Layer: 70.66,10.02 77.72,10.02 78.36,10.66 80.32,10.66 80.34,10.68 80.34,8.82 80.67,8.49 91.29,8.49 92.28,9.76 94.03,9.76 94.74,9.05 94.74,7.68 91.69,4.63 89.28,4.63 88.82,4.18 71.07,4.18 70.66,4.59 70.66,10.02
GND on Top Layer: 49.05,11.3 49.68,11.3 49.68,9.18 49.76,9.1 50.59,9.1 50.99,8.7 50.99,8.29 49.78,8.29 48.97,7.48 48.97,6.92 47.55,6.92 47.55,8.95 47.7,9.1 48.87,9.1 48.97,9.21 48.97,11.23
GND on Top Layer: 56.46,15.28 58.71,15.28 58.96,15.02 58.96,12.08 57.99,11.1 57.99,10.02 57.73,9.76 56.85,9.76 56.52,10.09 56.52,15.22
GND on Top Layer: 81.56,33.3 81.58,33.48 81.63,33.67 81.72,33.85 81.85,34.01 82.01,34.14 82.19,34.23 82.38,34.28 82.56,34.3 91.1,34.3 91.28,34.28 91.47,34.23 91.65,34.14 91.81,34.01 91.94,33.85 92.03,33.67 92.08,33.48 92.1,33.3 92.1,31.8 92.08,31.62 92.03,31.42 91.94,31.25 91.81,31.09 91.65,30.96 91.47,30.87 91.28,30.81 91.1,30.8 82.56,30.8 82.38,30.81 82.19,30.87 82.01,30.96 81.85,31.09 81.72,31.25 81.63,31.42 81.58,31.62 81.56,31.8
GND on Top Layer: 81.41,23.34 81.42,23.52 81.48,23.71 81.57,23.89 81.7,24.05 81.86,24.18 82.04,24.27 82.23,24.33 82.41,24.34 90.57,24.34 90.74,24.33 90.94,24.27 91.12,24.18 91.27,24.05 91.4,23.89 91.5,23.71 91.55,23.52 91.57,23.34 91.57,21.94 91.55,21.76 91.5,21.57 91.4,21.39 91.27,21.23 91.12,21.11 90.94,21.01 90.74,20.96 90.57,20.94 82.41,20.94 82.23,20.96 82.04,21.01 81.86,21.11 81.7,21.23 81.57,21.39 81.48,21.57 81.42,21.76 81.41,21.94
GND on Top Layer: 80.85,13.79 80.86,13.97 80.92,14.16 81.01,14.34 81.14,14.5 81.3,14.63 81.48,14.72 81.67,14.78 81.85,14.79 90.52,14.79 90.69,14.78 90.89,14.72 91.07,14.63 91.22,14.5 91.35,14.34 91.45,14.16 91.5,13.97 91.52,13.79 91.52,12.39 91.5,12.21 91.45,12.02 91.35,11.84 91.22,11.68 91.07,11.56 90.89,11.46 90.69,11.41 90.52,11.39 81.85,11.39 81.67,11.41 81.48,11.46 81.3,11.56 81.14,11.68 81.01,11.84 80.92,12.02 80.86,12.21 80.85,12.39
GND on Top Layer: 31.24,19.99 31.26,20.17 31.31,20.36 31.41,20.54 31.53,20.7 31.69,20.83 31.87,20.92 32.07,20.98 32.24,20.99 43.73,20.99 43.91,20.98 44.1,20.92 44.28,20.83 44.44,20.7 44.56,20.54 44.66,20.36 44.71,20.17 44.73,19.99 44.73,8.27 44.71,8.1 44.66,7.9 44.56,7.72 44.44,7.57 44.28,7.44 44.1,7.35 43.91,7.29 43.73,7.27 32.24,7.27 32.07,7.29 31.87,7.35 31.69,7.44 31.53,7.57 31.41,7.72 31.31,7.9 31.26,8.1 31.24,8.27
GND on Top Layer: 2.62,29.48 2.63,29.59 2.68,29.72 2.76,29.84 2.88,29.92 3.01,29.97 3.12,29.98 5.01,29.98 5.12,29.97 5.25,29.92 5.37,29.84 5.45,29.72 5.5,29.59 5.51,29.48 5.51,8.54 5.5,8.43 5.45,8.3 5.37,8.18 5.25,8.1 5.12,8.05 5.01,8.04 3.12,8.04 3.01,8.05 2.88,8.1 2.76,8.18 2.68,8.3 2.63,8.43 2.62,8.54
GND on Top Layer: 17.07,36.08 17.07,32.7 18.52,31.25 20.6,31.25 20.75,31.41 20.75,35.9 20.62,36.03 17.12,36.03
GND on Top Layer: 19.71,48.68 21.11,48.68 22.02,47.76 22.02,41.59 21.74,41.31 19.61,41.31 17.35,43.57 17.35,46.31
GND on Top Layer: 53.18,14.51 50.04,14.51 50.01,14.49 50.01,13.07 50.37,12.71 54.15,12.71 54.15,14.49 54.1,14.54 53.2,14.54
GND on Top Layer: 51.2,17.28 51.2,15.36 51.21,15.35 51.82,15.35 52.17,15.71 53.21,15.71 53.31,15.61 53.31,12.86 53.47,12.71 54.15,12.71 54.53,13.09 54.53,16.32 54.83,16.62 54.83,17.24 54.74,17.33 51.25,17.33
GND on Top Layer: 61.59,33.03 61.59,31.13 61.32,30.85 54.2,30.85 52.75,32.29 47.89,32.29 47.89,35.2 48.81,36.12 55.72,36.12 56.06,36.46 56.06,44.82 57.83,46.59 61.24,46.59 61.24,45.49 60.79,45.03 60.79,42.43 59.99,41.64 58.92,41.64 58.92,36.63 58.22,35.93 58.22,33.31 58.5,33.03
GND on Top Layer: 19.25,47.78 19.27,47.95 19.32,48.15 19.42,48.33 19.55,48.49 19.7,48.61 19.88,48.71 20.08,48.76 20.25,48.78 27.91,48.78 28.08,48.76 28.28,48.71 28.46,48.61 28.61,48.49 28.74,48.33 28.83,48.15 28.89,47.95 28.91,47.78 28.91,45.66 28.89,45.49 28.83,45.29 28.74,45.11 28.61,44.96 28.46,44.83 28.28,44.73 28.08,44.68 27.91,44.66 20.25,44.66 20.08,44.68 19.88,44.73 19.7,44.83 19.55,44.96 19.42,45.11 19.32,45.29 19.27,45.49 19.25,45.66
GND on Top Layer: 24.77,9.31 24.78,9.42 24.83,9.55 24.91,9.67 25.03,9.75 25.16,9.8 25.27,9.81 26.78,9.81 26.89,9.8 27.02,9.75 27.13,9.67 27.22,9.55 27.27,9.42 27.28,9.31 27.28,6.76 27.27,6.65 27.22,6.52 27.13,6.41 27.02,6.32 26.89,6.27 26.78,6.26 25.27,6.26 25.16,6.27 25.03,6.32 24.91,6.41 24.83,6.52 24.78,6.65 24.77,6.76
GND on Top Layer: 32.66,32.22 34.54,32.22 35.15,31.61 35.15,27.75 35.05,27.65 33.59,27.65 32.08,29.16 32.08,31.63
GND on Bottom Layer: -13.44,60.21 106.25,60.21 106.25,-14.67 -13.44,-14.67
VBUS on Top Layer: 27.08,43.04 27.66,43.04 27.66,41.39 27.94,41.11 28.7,41.11 28.96,41.36 29.42,41.36 31.4,43.34 34.98,43.34 37.62,40.7 46.08,40.7 47.5,39.28 48.97,39.28 48.97,36.31 35.51,36.31 35.43,36.23 33.99,37.68 33.99,41.21 33.68,41.51 31.71,41.51 31.37,41.17 31.37,40.62 30.59,39.84 27,39.84 26.67,40.17 26.67,40.98 27.08,41.39
VBUS on Top Layer: 48.44,38.87 52.5,38.87 52.86,38.52 55.52,38.52 55.78,38.26 55.78,36.82 55.34,36.38 48.44,36.38
VBUS on Top Layer: 22.2,41.82 22.78,41.82 22.78,40.32 22.81,40.29 21.29,38.77 21.21,38.77 21.21,37.56 20.74,37.09 17.68,37.09 17.58,36.99 17.58,39.66 19.02,41.11 21.84,41.11 22.2,41.46
VBUS on Bottom Layer: 18.57,41.31 18.57,39.41 18.85,39.13 22.23,39.13 22.33,39.23 22.35,39.23 22.87,39.75 30.02,39.75 30.47,40.19 30.47,41.68 30.33,41.82 19.08,41.82
+CAP on Top Layer: 52.93,27.39 69.22,27.39 69.22,22.57 68.91,22.26 64.06,22.26 64.01,22.31 63.68,22.31 62.71,23.28 48.16,23.28 48.16,25.79 52.66,25.79 52.93,26.07
+CAP on Top Layer: 68.58,28.61 71.55,28.61 71.55,11.59 68.58,11.59
+CAP on Top Layer: 63.7,10.99 66.57,10.99 69.1,13.52 70.54,13.52 70.54,10.43 69.49,9.39 63.7,9.39
+CAP on Top Layer: 70.97,28.88 78.76,28.88 78.76,26.16 70.97,26.16
+CAP on Top Layer: 70.28,38.16 77,38.16 77,36.14 76.63,35.77 72.47,35.77 72.14,35.44 72.14,28.2 69.72,28.2 69.62,28.31 69.62,37.5
CAP1 on Top Layer: 78.28,19.68 80.14,19.68 80.14,17.77 80.43,17.48 91.44,17.48 92.86,18.91 94.49,18.91 96.49,16.9 96.49,14.59 91.77,14.59 91.36,15 78.28,15
CAP2 on Top Layer: 78.83,29.48 80.51,29.48 80.51,27.84 81,27.34 91.9,27.34 92.91,28.36 94.46,28.36 96.47,26.35 96.47,24.09 91.62,24.09 91.24,24.57 78.62,24.57 78.62,25.75 79.1,26.22 79.1,28.08 78.83,28.34
CAP3 on Top Layer: 77.44,37.86 77.44,35.09 81.13,35.09 81.13,37.86
CAP3 on Top Layer: 79.12,36.69 79.12,34.76 79.27,34.61 91.64,34.61 92.97,33.63 94.06,33.63 96.37,33.64 96.37,36.12 94.59,37.91 83.39,37.91 82.17,36.69
WORK+ on Top Layer: 59.56,13.73 62.84,13.73 63.14,13.42 65.84,13.42 66.14,13.12 66.14,11.31 66.07,11.24 59.77,11.24 59.56,11.44
WORK+ on Top Layer: 59.56,14.84 61.71,14.84 61.71,12.86 59.56,12.86
$1N2189 on Top Layer: 55.14,22.16 58.14,22.16 58.31,21.99 58.31,19.2 57.96,18.86 55.35,18.86 53.21,16.72 52.16,16.72 52.16,17.75 54.08,19.67 54.08,21.09
$1N2240 on Top Layer: 59.84,16.32 61.39,16.32 61.39,14.96 59.84,14.96
$1N2253 on Top Layer: 59.12,38.94 59.13,38.93 59.13,38.06 61.19,38.06 62.41,36.84 67.62,36.84 68.07,37.3 68.07,39.66 67.89,39.84 62.41,39.84 61.49,38.92 61.48,38.94
$1N17016 on Top Layer: 80.7,11.05 91.31,11.05 91.31,8.85 80.7,8.85
$1N17478 on Top Layer: 80.61,20.7 91.49,20.7 91.49,18.22 91.31,18.04 80.61,18.04
$1N17851 on Top Layer: 80.74,30.45 91.77,30.45 91.77,28 80.74,28
$1N37952 on Top Layer: 67.44,33.94 68.45,32.93 68.45,30.64 65.51,27.7 54.31,27.7 54.25,27.75 54.25,29.79 54.5,30.03 61.75,30.03 61.8,30.08 61.8,32.22 63.53,33.94
$1N37952 on Top Layer: 49.3,32.12 49.3,30.31 49.33,30.29 52.62,30.29 52.85,30.05 52.85,29.76 53.24,29.37 53.24,29.12 54.5,27.86 55.46,27.86 55.75,28.15 55.75,30.69 54.12,30.69 52.7,32.12
$1N41094 on Top Layer: 10.13,34.71 10.29,34.55 14.96,34.55 15.01,34.61 15.01,37.7 18.65,41.34 18.65,41.77 17.79,42.63 15.49,42.63 14.22,41.36 10.13,41.36
$1N41094 on Top Layer: 9.93,37.55 15.21,37.55 16.64,36.13 16.81,36.13 16.81,32.55 18.42,30.95 20.29,30.95 22.96,28.28 22.96,25.51 21.59,24.14 16.18,24.14 15.62,24.7 15.62,28.97 14.76,29.83 10.69,29.83 9.93,30.59
$1N41220 on Top Layer: 54.98,16.42 56.11,16.42 56.57,16.88 58.77,16.88 59.38,17.49 59.38,17.95 60.1,18.66 60.1,21.8 60.45,22.16 62,22.16 62.1,22.06 62.1,16.04 61.71,15.65 55.1,15.65 54.98,15.77

## Text on the board
Bottom Silkscreen Layer: 填锡孔 | 蜗牛台点焊机V1.1
Document Layer: 8*8的方块用来打二维码的， / 如不需要可自行删除 | 版本变动 / V1.0 初版 / V1.1 / 将CH224k的1k电阻从0603更换成了1206 / 修复TypeC引脚的错误
Top Silkscreen Layer: 关 / 开 | 独立控制器 | 信号发生器 | 示波器 | GND | C3+ | C2+ | C1+ | 采集 | 触发 | PD充电 | 调流 | 外接电 / 源充电口 | 12V升压 | S G D
